# Altium project STEPPER-Board-v1.0.PrjPcb (part 1 of 6)
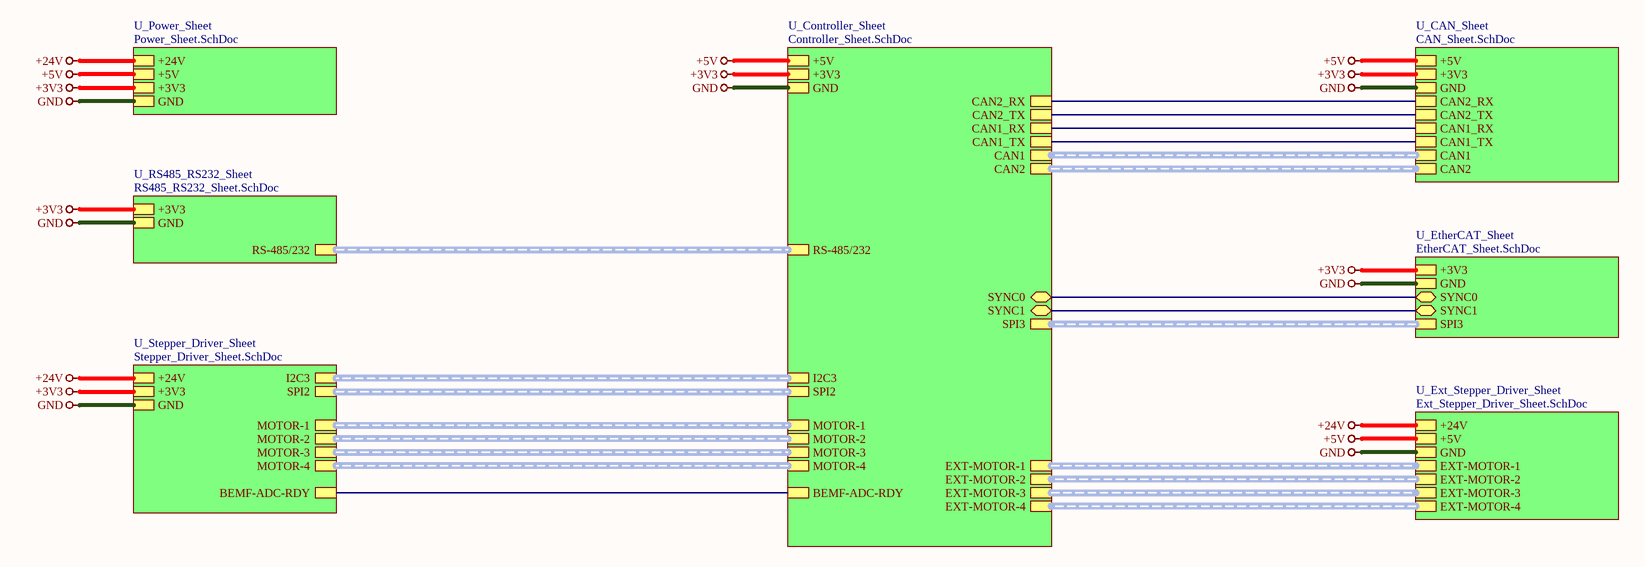
[diagram p0: Top-Sheet.SchDoc]
8 sheets, 410 parts. Net scope: hierarchical (ports join the sheet entries above them; power ports are global).
Board file: Stepper Board-v1.0.PcbDoc
Sheets:
  Top-Sheet.SchDoc
    U_Power_Sheet = Power_Sheet.SchDoc
    U_Controller_Sheet = Controller_Sheet.SchDoc
    U_CAN_Sheet = CAN_Sheet.SchDoc
    U_RS485_RS232_Sheet = RS485_RS232_Sheet.SchDoc
    U_EtherCAT_Sheet = EtherCAT_Sheet.SchDoc
    U_Stepper_Driver_Sheet = Stepper_Driver_Sheet.SchDoc
    U_Ext_Stepper_Driver_Sheet = Ext_Stepper_Driver_Sheet.SchDoc

## Sheet Top-Sheet.SchDoc
size 420 x 297 mm; DocumentNumber: 1; SheetNumber: 1

### Sub-sheets
U_CAN_Sheet = CAN_Sheet.SchDoc: CAN1 (harness CAN1), CAN2_RX, CAN2_TX, +5V, +3V3, GND, CAN1_RX, CAN1_TX, CAN2 (harness CAN2)
U_Controller_Sheet = Controller_Sheet.SchDoc: RS-485/232 (harness RS-485/232), CAN1 (harness CAN1), +3V3, GND, CAN2 (harness CAN2), SPI3 (harness SPI3), SPI2 (harness SPI2), I2C3 (harness I2C3), MOTOR-1 (harness MOTOR-1), MOTOR-2 (harness MOTOR-2), MOTOR-3 (harness MOTOR-3), MOTOR-4 (harness MOTOR-4), +5V, SYNC0 (bidir), SYNC1 (bidir), BEMF-ADC-RDY, EXT-MOTOR-1 (harness EXT-MOTOR-1), EXT-MOTOR-2 (harness EXT-MOTOR-2), EXT-MOTOR-3 (harness EXT-MOTOR-3), EXT-MOTOR-4 (harness EXT-MOTOR-4), CAN2_RX, CAN2_TX, CAN1_RX, CAN1_TX
U_EtherCAT_Sheet = EtherCAT_Sheet.SchDoc: +3V3, GND, SYNC0 (bidir), SYNC1 (bidir), SPI3 (harness SPI3)
U_Ext_Stepper_Driver_Sheet = Ext_Stepper_Driver_Sheet.SchDoc: +5V, GND, EXT-MOTOR-1 (harness EXT-MOTOR-1), EXT-MOTOR-2 (harness EXT-MOTOR-2), EXT-MOTOR-3 (harness EXT-MOTOR-3), EXT-MOTOR-4 (harness EXT-MOTOR-4), +24V
U_Power_Sheet = Power_Sheet.SchDoc: +24V, +5V, +3V3, GND
U_RS485_RS232_Sheet = RS485_RS232_Sheet.SchDoc: RS-485/232 (harness RS-485/232), +3V3, GND
U_Stepper_Driver_Sheet = Stepper_Driver_Sheet.SchDoc: +24V, +3V3, GND, I2C3 (harness I2C3), SPI2 (harness SPI2), MOTOR-1 (harness MOTOR-1), MOTOR-2 (harness MOTOR-2), MOTOR-3 (harness MOTOR-3), MOTOR-4 (harness MOTOR-4), BEMF-ADC-RDY

### Nets
+3V3: sheet U_Power_Sheet/+3V3, sheet U_Controller_Sheet/+3V3, sheet U_CAN_Sheet/+3V3, sheet U_RS485_RS232_Sheet/+3V3, sheet U_EtherCAT_Sheet/+3V3, sheet U_Stepper_Driver_Sheet/+3V3
+5V: sheet U_Power_Sheet/+5V, sheet U_Controller_Sheet/+5V, sheet U_CAN_Sheet/+5V, sheet U_Ext_Stepper_Driver_Sheet/+5V
+24V: sheet U_Power_Sheet/+24V, sheet U_Stepper_Driver_Sheet/+24V, sheet U_Ext_Stepper_Driver_Sheet/+24V
GND: sheet U_Power_Sheet/GND, sheet U_Controller_Sheet/GND, sheet U_CAN_Sheet/GND, sheet U_RS485_RS232_Sheet/GND, sheet U_EtherCAT_Sheet/GND, sheet U_Stepper_Driver_Sheet/GND, sheet U_Ext_Stepper_Driver_Sheet/GND
BEMF-ADC-RDY: sheet U_Controller_Sheet/BEMF-ADC-RDY, sheet U_Stepper_Driver_Sheet/BEMF-ADC-RDY
CAN1_RX: sheet U_Controller_Sheet/CAN1_RX, sheet U_CAN_Sheet/CAN1_RX
CAN1_TX: sheet U_Controller_Sheet/CAN1_TX, sheet U_CAN_Sheet/CAN1_TX
CAN2_RX: sheet U_Controller_Sheet/CAN2_RX, sheet U_CAN_Sheet/CAN2_RX
CAN2_TX: sheet U_Controller_Sheet/CAN2_TX, sheet U_CAN_Sheet/CAN2_TX
SYNC0: sheet U_Controller_Sheet/SYNC0, sheet U_EtherCAT_Sheet/SYNC0
SYNC1: sheet U_Controller_Sheet/SYNC1, sheet U_EtherCAT_Sheet/SYNC1

### Buses and harness runs
harness sheet U_CAN_Sheet/CAN1 = sheet U_Controller_Sheet/CAN1
harness sheet U_CAN_Sheet/CAN2 = sheet U_Controller_Sheet/CAN2
harness sheet U_Controller_Sheet/EXT-MOTOR-1 = sheet U_Ext_Stepper_Driver_Sheet/EXT-MOTOR-1
harness sheet U_Controller_Sheet/EXT-MOTOR-2 = sheet U_Ext_Stepper_Driver_Sheet/EXT-MOTOR-2
harness sheet U_Controller_Sheet/EXT-MOTOR-3 = sheet U_Ext_Stepper_Driver_Sheet/EXT-MOTOR-3
harness sheet U_Controller_Sheet/EXT-MOTOR-4 = sheet U_Ext_Stepper_Driver_Sheet/EXT-MOTOR-4
harness sheet U_Controller_Sheet/I2C3 = sheet U_Stepper_Driver_Sheet/I2C3
harness sheet U_Controller_Sheet/MOTOR-1 = sheet U_Stepper_Driver_Sheet/MOTOR-1
harness sheet U_Controller_Sheet/MOTOR-2 = sheet U_Stepper_Driver_Sheet/MOTOR-2
harness sheet U_Controller_Sheet/MOTOR-3 = sheet U_Stepper_Driver_Sheet/MOTOR-3
harness sheet U_Controller_Sheet/MOTOR-4 = sheet U_Stepper_Driver_Sheet/MOTOR-4
harness sheet U_Controller_Sheet/RS-485/232 = sheet U_RS485_RS232_Sheet/RS-485/232
harness sheet U_Controller_Sheet/SPI2 = sheet U_Stepper_Driver_Sheet/SPI2
harness sheet U_Controller_Sheet/SPI3 = sheet U_EtherCAT_Sheet/SPI3

### Notes on the sheet
- File:
- Title:
- Date:
- Page
- Num:
- Total:
- Drawn By: Huzaifa Ali

## Sheet Power_Sheet.SchDoc
size 420 x 297 mm; DocumentNumber: 2; SheetNumber: 2; SheetTotal: 14
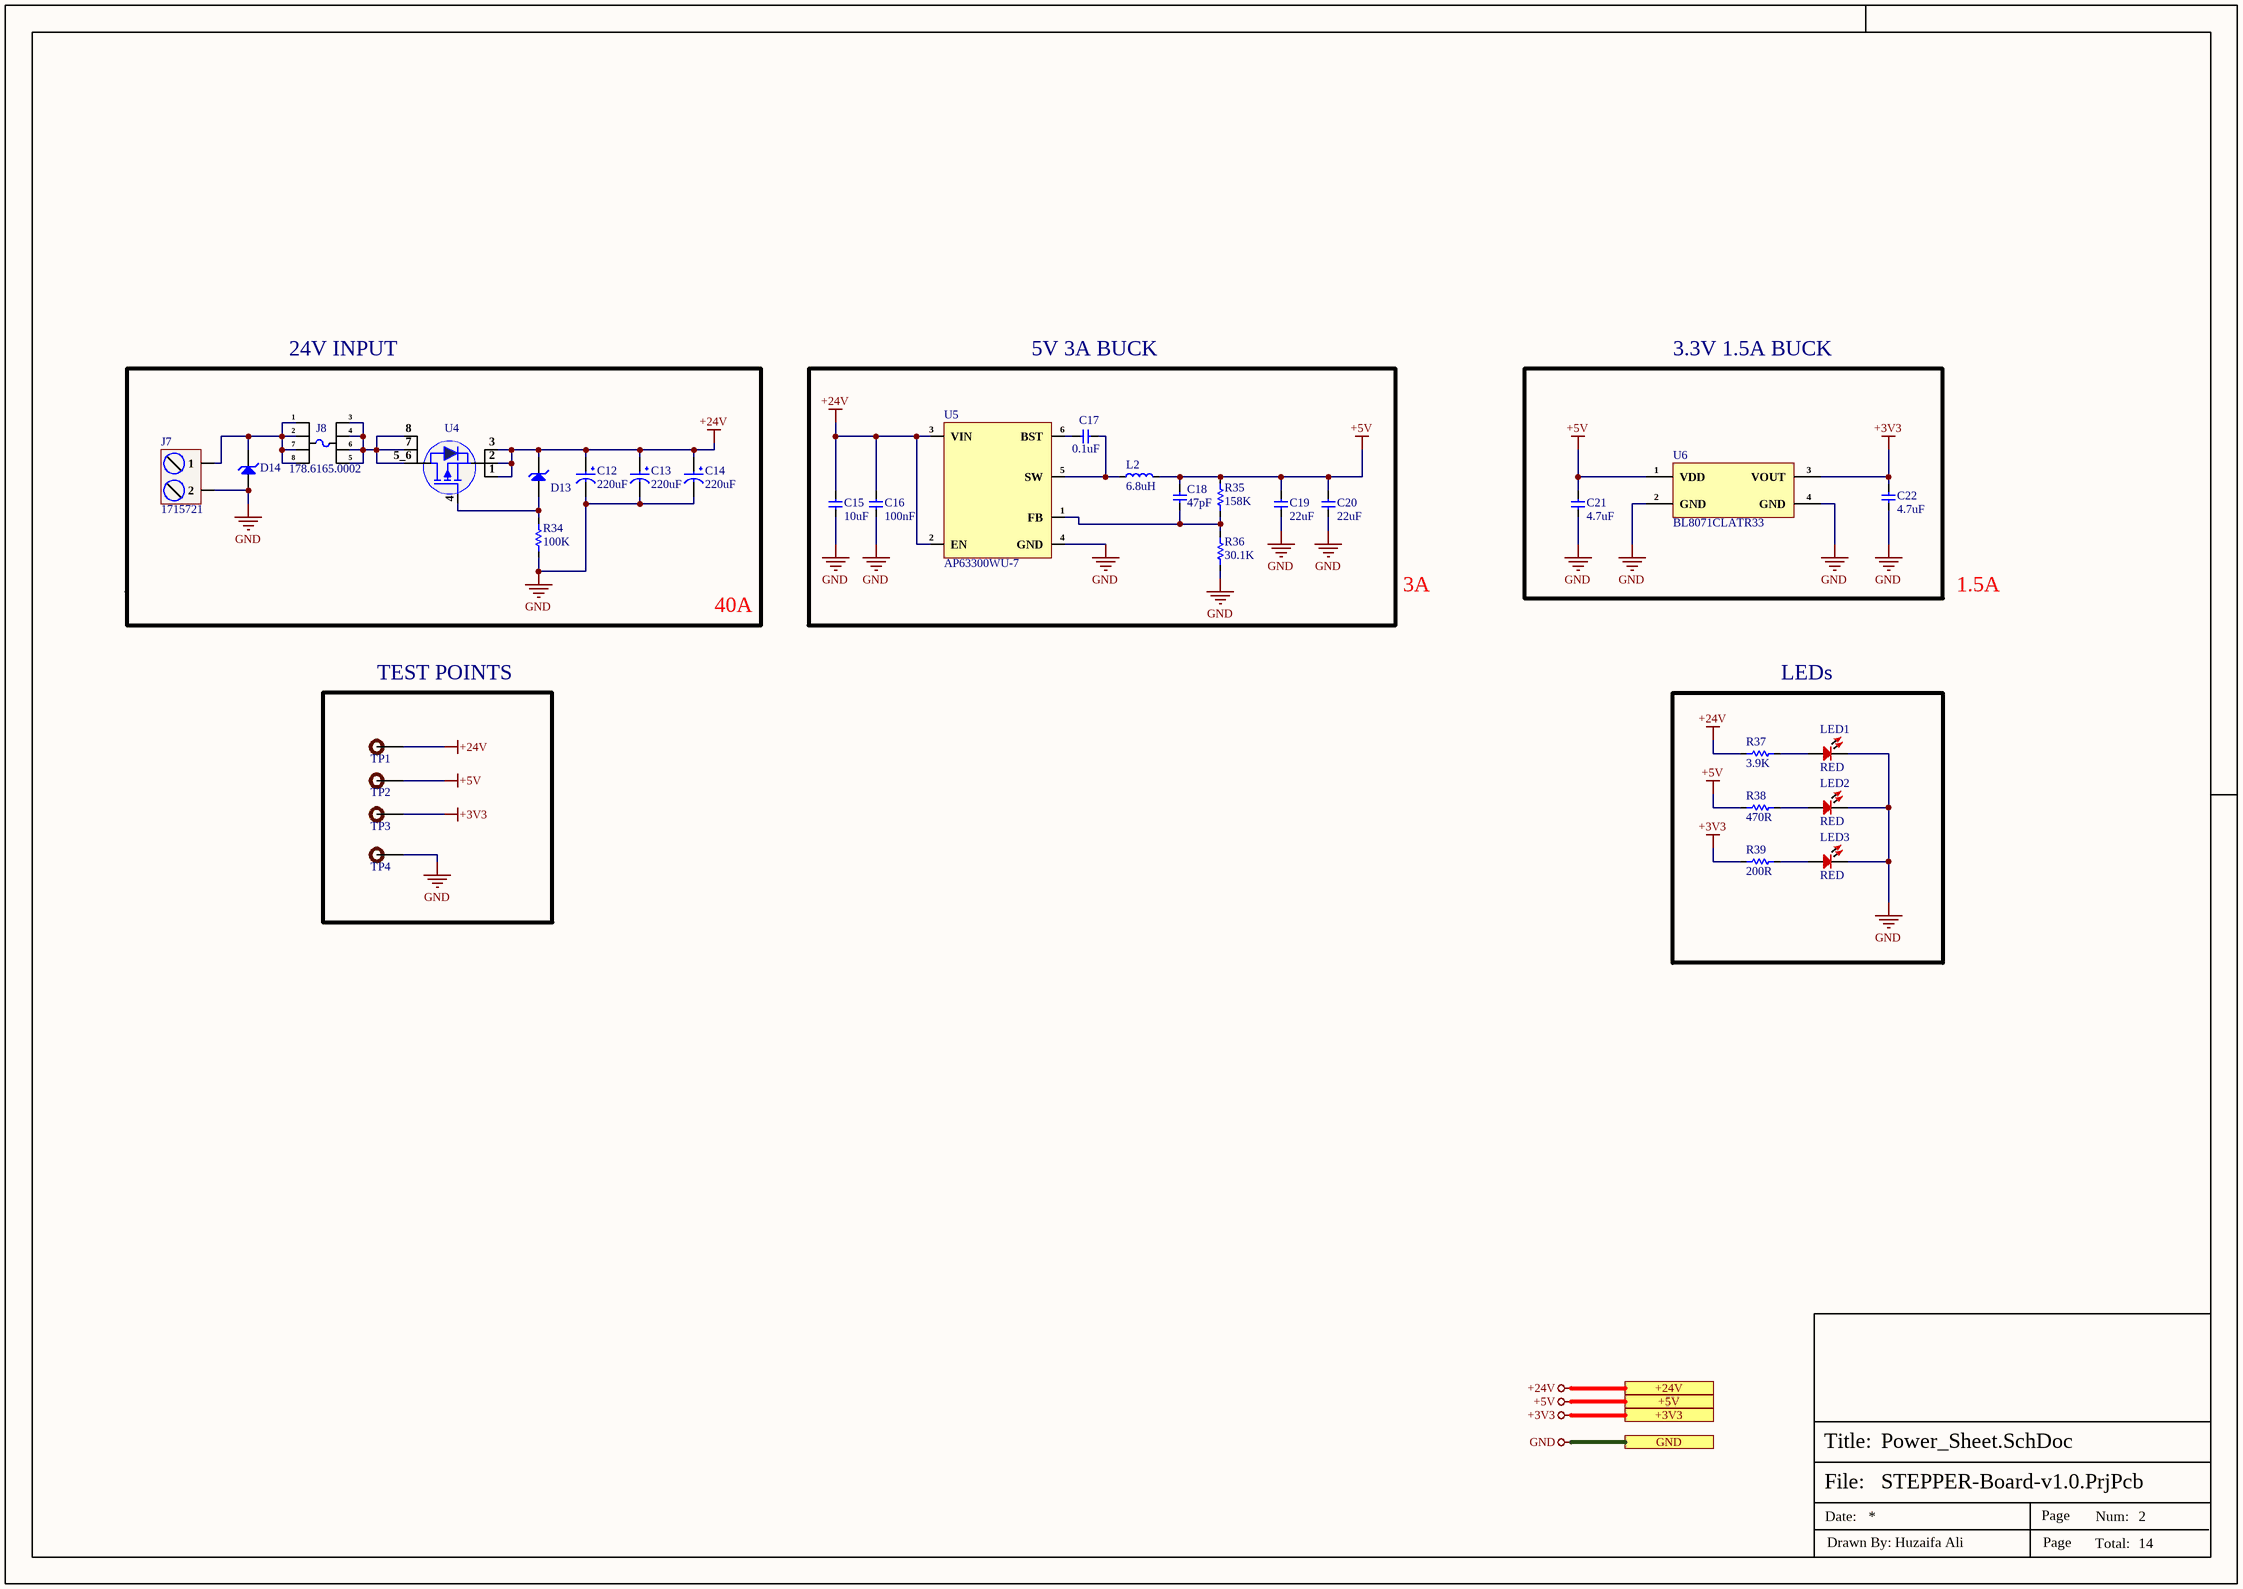
[diagram p1: Power_Sheet.SchDoc]

### Parts
C12  220uF  [UCD-220uF-10mmDia]
C13  220uF  [UCD-220uF-10mmDia]
C14  220uF  [UCD-220uF-10mmDia]
C15  10uF  [Cap-1206]
C16  100nF  [cap-0402]
C17  0.1uF  [Cap-0402]
C18  47pF  [Cap-0402]
C19  22uF  [Cap-0805]
C20  22uF  [Cap-0805]
C21  4.7uF  [Cap-0603]
C22  4.7uF  [Cap-0603]
D13  BZT52C16  [SOD-123]  (value not drawn)
D14  SMBJ28A-13-F  [SMB_]  (value not drawn)
J7  1715721  [1715721]
J8  178.6165.0002  [178.6165.0002]
L2  6.8uH  [0630CDMCCDS_6R8MC]
LED1  RED  [LED-0603]
LED2  RED  [LED-0603]
LED3  RED  [LED-0603]
R34  100K  [Res-0402]
R35  158K  [Res-0402]
R36  30.1K  [Res-0402]
R37  3.9K  [Res-0402]
R38  470R  [Res-0402]
R39  200R  [Res-0402]
TP1  TEST POINT  [Test-point]  (value not drawn)  (no BOM)
TP2  TEST POINT  [Test-point]  (value not drawn)  (no BOM)
TP3  TEST POINT  [Test-point]  (value not drawn)  (no BOM)
TP4  TEST POINT  [Test-point]  (value not drawn)  (no BOM)
U4  SI7145DP-T1-GE3  [PowerPAK-SO-8]  (value not drawn)
U5  AP63300WU-7  [TSOT-23-6]
U6  BL8071CLATR33  [SOT- 223]

### Blocks framed on the sheet
5V 3A BUCK: C15-C20 L2 R35 R36 U5
3.3V 1.5A BUCK: C21 C22 U6
TEST POINTS: TP1-TP4

### Ports
+3V3 (see Top-Sheet[1A], CAN_Sheet[5D], Controller_Sheet[5D], EtherCAT_Sheet[5D], RS485_RS232_Sheet[2D], Stepper_Driver_Sheet[5D]), +5V (see Top-Sheet[1A], CAN_Sheet[5D], Controller_Sheet[5D], Ext_Stepper_Driver_Sheet[5D]), +24V (see Top-Sheet[1A], Ext_Stepper_Driver_Sheet[5D], Stepper_Driver_Sheet[5D]), GND (see Top-Sheet[1A], CAN_Sheet[5D], Controller_Sheet[5D], EtherCAT_Sheet[5D], Ext_Stepper_Driver_Sheet[5D], RS485_RS232_Sheet[2D], Stepper_Driver_Sheet[5D])

### Nets
+3V3: C22.2 R39.1 TP3.1 U6.3(VOUT) ; port +3V3
+5V: C18.2 C19.2 C20.2 C21.2 L2.2 R35.2 R38.1 TP2.1 U6.1(VDD) ; port +5V
+24V: C12.1 C13.1 C14.1 C15.2 C16.2 D13.2(K) R37.1 TP1.1 U4.1(S) U4.2(S) U4.3(S) U5.2(EN) U5.3(VIN) ; port +24V
GND: C12.2 C13.2 C14.2 C15.1 C16.1 C19.1 C20.1 C21.1 C22.1 D14.1(A) J7.2 LED1.2 LED2.2 LED3.2 R34.1 R36.1 TP4.1 U5.4(GND) U6.2(GND) U6.4(GND) ; port GND
NetC17_1: C17.1 L2.1 U5.5(SW)
NetC17_2: C17.2 U5.6(BST)
NetC18_1: C18.1 R35.1 R36.2 U5.1(FB)
NetD13_1: D13.1(A) R34.2 U4.4(G)
NetD14_2: D14.2(K) J7.1 J8.1 J8.2 J8.7 J8.8
NetJ8_3: J8.3 J8.4 J8.5 J8.6 U4.5_6(D) U4.7(D) U4.8(D)
NetLED1_1: LED1.1 R37.2
NetLED2_1: LED2.1 R38.2
NetLED3_1: LED3.1 R39.2

### Notes on the sheet
- 24V INPUT
- 3A
- 1.5A
- 40A
- LEDs
- File:
- Title:
- Date:
- Page
- Num:
- Total:
- Drawn By: Huzaifa Ali

### Library data of the parts
C12-C14 = UCD1H221MNL1GS: CAP ALUM 220UF 20% 50V SMD; Manufacturer: Nichicon; Ripple Current: 700mA; Impedance: 160mR; Leakage Current: 3uA; Life (Hours): 5000Hour; Dissipation Factor: 0.1%; Item Type: Capacitor; Supplier 1: Digi-Key; Manufacturer Part Number: UCD1H221MNL1GS; RoHS: Yes; Category: Aluminum Electrolytic Capacitors; Pricing 1: 1=0.85000, 10=0.60200, 50=0.45480, 100=0.39620 (USD); Mount: Surface Mount,PCB; Case/Package: Radial; Min Operating Temperature: -55°C; Max Operating Temperature: 105°C; Capacitance: 220uF; Tolerance: 20%; Voltage Rating: 50V; Packaging: Tape and Reel; Package Quantity: 1; Voltage Rating (DC): 50V; Termination: SMD/SMT; Voltage: 50V; Features: General Purpose; Series: CD; Construction: Cylindrical; Diameter: 10mm; Length: 10mm; Height: 10mm; Height - Seated (Max): 0.394inch; Radiation Hardening: No; Lead Free: Lead Free; RoHS Compliant: Yes; ComponentLink1URL: https://datasheet.ciiva.com/11776/0900766b80ebdadd-11776792.pdf?src-supplier=RSComponents; ComponentLink1Description: https://datasheet.ciiva.com/11776/0900766b80ebdadd-11776792.pdf?src-supplier=RSComponents; ComponentLink2URL: https://datasheet.ciiva.com/5362/e-cd-22158-5362489.pdf?src-supplier=Mouser; ComponentLink2Description: https://datasheet.ciiva.com/5362/e-cd-22158-5362489.pdf?src-supplier=Mouser; ComponentLink3URL: https://datasheet.ciiva.com/11684/e-cd-11684678.pdf?src-supplier=Avnet; ComponentLink3Description: https://datasheet.ciiva.com/11684/e-cd-11684678.pdf?src-supplier=Avnet; ComponentLink4URL: https://datasheet.ciiva.com/15037/e-cd-15037119.pdf?src-supplier=Digi-Key; ComponentLink4Description: https://datasheet.ciiva.com/15037/e-cd-15037119.pdf?src-supplier=Digi-Key; ComponentLink5URL: https://datasheet.ciiva.com/16393/e-cd-16393493.pdf?src-supplier=Future+Electronics; ComponentLink5Description: https://datasheet.ciiva.com/16393/e-cd-16393493.pdf?src-supplier=Future+Electronics; ComponentLink6URL: https://datasheet.ciiva.com/17354/e-cd-17354606.pdf?src-supplier=Avnet+Europe; ComponentLink6Description: https://datasheet.ciiva.com/17354/e-cd-17354606.pdf?src-supplier=Avnet+Europe; Supplier Part Number 1: 493-6390-1-ND; LCSC Part Number: C116211
C15 = CC1206KKX5R9BB106: CAP CER 10UF 50V X5R 1206; Manufacturer: Yageo; Item Type: Capacitors; Material: 4241ConductorMaterial; Tolerance: 10%; Supplier: Future Electronics; Supplier Part Number: 2072123; Manufacturer Part Number: CC1206KKX5R9BB106; RoHS: Yes; Stock: 220000; Pricing: 2000=0.0907, 6000=0.0872, 10000=0.0856, 30000=0.0823, 50000=0.0795 (USD); Mounting Technology: Surface Mount; Case/Package: 1206; Case Code (Imperial): 1206; Case Code (Metric): 3216; Min Operating Temperature: -55°C; Max Operating Temperature: 85°C; Packaging: Cut Tape; Value: 10uF; Voltage Rating: 50V; Voltage Rating (DC): 50V; Dielectric: X5R; Series: CC; Length: 0.126inch; Width: 0.063inch; Height: 1.9mm; Thickness: 0.075inch; Lead Free: Lead Free; Halogen Free: Halogen Free; RoHS Compliant: Yes; ComponentLink1URL: https://datasheet.octopart.com/CC1206KKX5R9BB106-Yageo-datasheet-170350636.pdf?src-supplier=Future+Electronics; ComponentLink1Description: https://datasheet.octopart.com/CC1206KKX5R9BB106-Yageo-datasheet-170350636.pdf?src-supplier=Future+Electronics; ComponentLink2URL: https://datasheet.octopart.com/CC1206KKX5R9BB106-Yageo-datasheet-145016144.pdf?src-supplier=Future+Electronics; ComponentLink2Description: https://datasheet.octopart.com/CC1206KKX5R9BB106-Yageo-datasheet-145016144.pdf?src-supplier=Future+Electronics; ComponentLink3URL: http://www.yageo.com/documents/recent/UPY-GPHC_X5R_4V-to-50V_25.pdf?src-supplier=Digikey; ComponentLink3Description: http://www.yageo.com/documents/recent/UPY-GPHC_X5R_4V-to-50V_25.pdf?src-supplier=Digikey; LCSC Part Number: C100122
C16 = C1005X7R1H104KT000F: CAP CER 0.1UF 50V X7R 0402; Manufacturer: TDK; Tolerance: 10%; Voltage: 25V; Item Type: Capacitor; Supplier 1: Avnet; Manufacturer Part Number: C1005X7R1H104KT000F; RoHS: No; Category: Ceramic Capacitors; Dielectric: X7R; Supplier Part Number 1: C1005X7R1H104KT000F; LCSC Part Number: C361198; ComponentLink1Description: LCSC; ComponentLink1URL: https://www.lcsc.com/product-detail/Multilayer-Ceramic-Capacitors-MLCC-SMD-SMT_TDK-C1005X7R1H104KT000F_C361198.html
C17 = C1005X5R1H104K050BB: CAP CER 0.1UF 50V X5R 0402; Manufacturer: TDK; Dielectric Material: Ceramic; Capacitance: 100nF; Tolerance: 10%; Item Type: Capacitor; Supplier 1: Digi-Key; Manufacturer Part Number: C1005X5R1H104K050BB; Stock 1: 1455182; Pricing 1: 1=0.12, 10=0.09, 50=0.049, 100=0.04, 500=0.02858, 1000=0.02245, 2500=0.02041, 5000=0.01878 (USD); Mount: Surface Mount; Case/Package: 0402; Case Code (Metric): 1005; Case Code (Imperial): 0402; Weight: 2.3E-05oz; Min Operating Temperature: -55°C; Max Operating Temperature: 85°C; Dielectric: X5R; Voltage Rating: 50V; Packaging: Tape and Reel; Voltage Rating (DC): 50V; Termination: SMD/SMT; Construction: Flat; Package Quantity: 1; Resistor Type: Ceramic; Voltage: 50V; Series: C; Length: 1mm; Width: 0.02inch; Height: 0.5mm; Depth: 0.5mm; Thickness: 0.022inch; Radiation Hardening: No; Lead Free: Lead Free; REACH SVHC: No SVHC; RoHS Compliant: Yes; ComponentLink1URL: https://product.tdk.com/info/en/catalog/spec/mlccspec_commercial_general_midvoltage_en.pdf?src-supplier=Digi-Key; ComponentLink1Description: https://product.tdk.com/info/en/catalog/spec/mlccspec_commercial_general_midvoltage_en.pdf?src-supplier=Digi-Key; ComponentLink2URL: http://www.tdk.co.jp/tefe02/e413_c.pdf?src-supplier=Future+Electronics; ComponentLink2Description: http://www.tdk.co.jp/tefe02/e413_c.pdf?src-supplier=Future+Electronics; ComponentLink3URL: https://www.verical.com/server-webapp/html/getDatasheet?partID=743571&src-supplier=Verical; ComponentLink3Description: https://www.verical.com/server-webapp/html/getDatasheet?partID=743571&src-supplier=Verical; ComponentLink4URL: http://www.tdk.co.jp/tefe02/e412_c.pdf?src-supplier=Avnet+Europe; ComponentLink4Description: http://www.tdk.co.jp/tefe02/e412_c.pdf?src-supplier=Avnet+Europe; Supplier Part Number 1: 445-5942-1-ND; LCSC Part Number: C2181865
C18 = GCM1555C1H470FA16D: CAP CER 47PF 50V C0G/NP0 0402; Manufacturer: Murata; Tolerance: 1%; Supplier 1: Digi-Key; Manufacturer Part Number: GCM1555C1H470FA16D; RoHS: No; Category: Ceramic Capacitors; Stock 1: 27098; Pricing 1: 1=0.11000, 10=0.07900, 50=0.04500, 100=0.03730, 500=0.02618, 1000=0.02168, 2500=0.02018, 5000=0.01846 (USD); Mount: Surface Mount; Case/Package: 0402; Case Code (Imperial): 0402; Case Code (Metric): 1005; Min Operating Temperature: -55°C; Max Operating Temperature: 125°C; Packaging: Tape and Reel; Capacitance: 47pF; Voltage Rating: 50V; Ratings: AEC-Q200; ComponentLink1URL: http://search.murata.co.jp/Ceramy/image/img/A01X/G101/ENG/GCM1555C1H470FA16-01.pdf?src-supplier=Digi-Key; ComponentLink1Description: http://search.murata.co.jp/Ceramy/image/img/A01X/G101/ENG/GCM1555C1H470FA16-01.pdf?src-supplier=Digi-Key; Supplier Part Number 1: 490-16445-1-ND; LCSC Part Number: C393684
C19 C20 = CC0805MKX5R8BB226: CAP CER 22UF 25V X5R 0805; Manufacturer: Yageo; Tolerance: 20%; Item Type: Capacitor; Supplier 1: Digi-Key; Manufacturer Part Number: CC0805MKX5R8BB226; RoHS: Yes; Category: Ceramic Capacitors; Stock 1: 64970; Pricing 1: 1=0.47000, 10=0.33300, 50=0.25140, 100=0.21900, 500=0.16222, 1000=0.13789 (USD); Mount: Surface Mount; Case/Package: 0805; Case Code (Metric): 2012; Case Code (Imperial): 0805; Weight: 0.000194oz; Min Operating Temperature: -55°C; Max Operating Temperature: 85°C; Packaging: Tape and Reel; Capacitance: 22uF; Voltage Rating: 25V; Dielectric: X5R; Termination: SMD/SMT; Voltage Rating (DC): 25V; Package Quantity: 3000; Length: 0.079inch; Width: 0.049inch; Height: 1.25mm; Thickness: 0.057inch; Lead Free: Lead Free; Halogen Free: Halogen Free; RoHS Compliant: Yes; ComponentLink1URL: http://www.mouser.com/ds/2/447/Yageo_UPY-GP_NP0_16V-to-50V_9-358835.pdf?src-supplier=Mouser; ComponentLink1Description: http://www.mouser.com/ds/2/447/Yageo_UPY-GP_NP0_16V-to-50V_9-358835.pdf?src-supplier=Mouser; ComponentLink2URL: http://www.yageo.com/documents/recent/UPY-GPHC_X5R_4V-to-50V_25.pdf?src-supplier=Digi-Key; ComponentLink2Description: http://www.yageo.com/documents/recent/UPY-GPHC_X5R_4V-to-50V_25.pdf?src-supplier=Digi-Key; Supplier Part Number 1: 311-1903-1-ND; LCSC Part Number: C784585
C21 C22 = CC0603KRX5R7BB475: CAP CER 4.7UF 16V X5R 0603; Manufacturer: Yageo; Tolerance: 10%; Item Type: Capacitor; Supplier 1: Digi-Key; Manufacturer Part Number: CC0603KRX5R7BB475; RoHS: Yes; Category: Ceramic Capacitors; Stock 1: 547703; Pricing 1: 1=0.20000, 10=0.13800, 50=0.08280, 100=0.06990, 500=0.04784, 1000=0.04233 (USD); Mount: Surface Mount; Case/Package: 0603; Case Code (Imperial): 0603; Case Code (Metric): 1608; Weight: 7.1E-05oz; Min Operating Temperature: -55°C; Max Operating Temperature: 85°C; Capacitance: 4.7uF; Voltage Rating: 16V; Voltage Rating (DC): 16V; Packaging: Tape and Reel; Dielectric: X5R; Termination: SMD/SMT; Resistor Type: Ceramic; Series: CC; Length: 1.6mm; Width: 0.8mm; Height: 0.8mm; Thickness: 0.037inch; Depth: 0.8mm; Lead Free: Lead Free; Halogen Free: Halogen Free; RoHS Compliant: Yes; ComponentLink1URL: http://www.mouser.com/ds/2/447/UPY-GPHC_X5R_4V-to-50V_25-1131599.pdf?src-supplier=Mouser; ComponentLink1Description: http://www.mouser.com/ds/2/447/UPY-GPHC_X5R_4V-to-50V_25-1131599.pdf?src-supplier=Mouser; ComponentLink2URL: http://www.yageo.com/documents/recent/UPY-GPHC_X5R_4V-to-50V_25.pdf?src-supplier=Digi-Key; ComponentLink2Description: http://www.yageo.com/documents/recent/UPY-GPHC_X5R_4V-to-50V_25.pdf?src-supplier=Digi-Key; Supplier Part Number 1: 311-1785-1-ND; LCSC Part Number: C277476
D13 = BZT52C16: ±5% Single 15.3V~17.1V 500mW 16V SOD-123 Zener Diodes ROHS; Manufacturer: Shikues; Manufacturer Part Number: BZT52C16; Package: SOD-123; LCSC Part Number: C216724; Item Type: Zener Diode; ComponentLink1Description: LCSC; ComponentLink1URL: https://www.lcsc.com/product-detail/Zener-Diodes_Shikues-BZT52C16_C216724.html
D14 = SMBJ28A-13-F: TVS DIODE 28VWM 45.4VC SMB; Manufacturer: Diodes; Test Current: 1mA; Number of Elements: 1; Power Dissipation: 600W; Forward Voltage: 5V; Direction: Unidirectional; Reverse Breakdown Voltage: 31.1V; Max Surge Current: 13.2A; Reverse Standoff Voltage: 28V; Clamping Voltage: 45.4V; Power Line Protection: No; Breakdown Voltage: 35.8V; Max Reverse Leakage Current: 5uA; Value: 330pF; Diode Type: ZENER; Supplier: Future Electronics; Supplier Part Number: 8797342; Manufacturer Part Number: SMBJ28A-13-F; RoHS: Yes; Category: TVS Diodes; Stock: 39000; Pricing: 3000=0.0734, 9000=0.0706, 15000=0.0693, 30000=0.0676, 60000=0.065 (USD); Mounting Technology: Surface Mount; Case/Package: SMB; Pins: 2; Min Operating Temperature: -55°C; Max Operating Temperature: 150°C; Packaging: Tape and Reel; Package Quantity: 3000; Max Power Dissipation: 600W; Series: SMBJ; Number of Unidirectional Channels: 1; Min Breakdown Voltage: 31.1V; Peak Pulse Power: 600W; Polarity: Unidirectional; Termination: SMD/SMT; Peak Pulse Current: 13.2A; Max Breakdown Voltage: 35.8V; Leakage Current: 5uA; Working Voltage: 28V; Voltage Rating (DC): 28V; Max Output current: 13.2A; Clamping Voltage-Max: 45.4V; Length: 4.57mm; Width: 3.9mm; Height: 2.62mm; Radiation Hardening: No; RoHS Compliant: Yes; Lead Free: Lead Free; ComponentLink1URL: https://datasheet.ciiva.com/16387/ds19002-16387564.pdf?src-supplier=Future+Electronics; ComponentLink1Description: https://datasheet.ciiva.com/16387/ds19002-16387564.pdf?src-supplier=Future+Electronics; ComponentLink2URL: https://datasheet.ciiva.com/26912/getdatasheetpartid-234000-26912533.pdf?src-supplier=Verical; ComponentLink2Description: https://datasheet.ciiva.com/26912/getdatasheetpartid-234000-26912533.pdf?src-supplier=Verical; Item Type: Diode
J7 = 1715721: TERM BLK 2P SIDE ENT 5.08MM PCB; Manufacturer: Phoenix Contact; Item Type: Terminal Blocks; Supplier: Digikey; Supplier Part Number: 277-1263-ND; Manufacturer Part Number: 1715721; RoHS: Yes; Stock: 13160; Pricing: 1=0.94 (USD); ComponentLink1URL: https://datasheet.ciiva.com/1120/1697161-1120393.pdf?src-supplier=Farnell; ComponentLink1Description: https://datasheet.ciiva.com/1120/1697161-1120393.pdf?src-supplier=Farnell; ComponentLink2URL: https://datasheet.ciiva.com/832/1715721-832095.pdf?src-supplier=Digikey; ComponentLink2Description: https://datasheet.ciiva.com/832/1715721-832095.pdf?src-supplier=Digikey; ComponentLink3URL: https://datasheet.ciiva.com/15169/getdatasheetpartid-212174-15169929.pdf?src-supplier=Verical; ComponentLink3Description: https://datasheet.ciiva.com/15169/getdatasheetpartid-212174-15169929.pdf?src-supplier=Verical; ComponentLink4URL: https://datasheet.ciiva.com/16046/1715721-16046034.pdf?src-supplier=Onlinecomponents.com; ComponentLink4Description: https://datasheet.ciiva.com/16046/1715721-16046034.pdf?src-supplier=Onlinecomponents.com
J8 = 178.6165.0002: FUSE HOLDER BLADE 80V PCB; Manufacturer: Littelfuse Wickmann; Body Material: 4896ConductorMaterial; Current Rating: 30A; Supplier: Future Electronics; Supplier Part Number: 9883406; Manufacturer Part Number: 178.6165.0002; RoHS: Yes; Category: Fuse Holders; Stock: 3811; Pricing: 1=2.02, 40=1.96, 125=1.91, 400=1.86, 1250=1.77 (USD); Material: 4896ConductorMaterial; Width: 17.5mm; Thickness: 6mm; Lead Free: 5697LeadFree; ComponentLink1URL: https://datasheet.ciiva.com/295/littelfuse-ato-pcb-fuse-holders-178-6765-295568.pdf?src-supplier=Digikey; ComponentLink1Description: https://datasheet.ciiva.com/295/littelfuse-ato-pcb-fuse-holders-178-6765-295568.pdf?src-supplier=Digikey; ComponentLink2URL: https://datasheet.ciiva.com/4480/flrholder-58019-4480354.pdf?src-supplier=Mouser; ComponentLink2Description: https://datasheet.ciiva.com/4480/flrholder-58019-4480354.pdf?src-supplier=Mouser; ComponentLink3URL: https://datasheet.ciiva.com/16372/flrholder-16372408.pdf?src-supplier=Future+Electronics; ComponentLink3Description: https://datasheet.ciiva.com/16372/flrholder-16372408.pdf?src-supplier=Future+Electronics; ComponentLink4URL: https://datasheet.ciiva.com/15187/getdatasheetpartid-31610-15187861.pdf?src-supplier=Verical; ComponentLink4Description: https://datasheet.ciiva.com/15187/getdatasheetpartid-31610-15187861.pdf?src-supplier=Verical; LCSC Part Number: C207061; Item Type: Fuse Holder
L2 = 0630CDMCCDS-6R8MC: FIXED IND 6.8UH 5A 48 MOHM SMD; Manufacturer: Sumida; Core Material: Metal; Saturation Current: 6.3A; Shielding: Shielded; DC Resistance (DCR): 48mR; Test Frequency: 100kHz; Tolerance: 20%; Item Type: Inductor; Supplier 1: Digi-Key; Manufacturer Part Number: 0630CDMCCDS-6R8MC; Stock 1: 1582; Pricing 1: 1=0.97, 10=0.845, 25=0.7848, 50=0.6642, 100=0.6038, 250=0.56752, 500=0.50716 (USD); Mount: Surface Mount; Case/Package: Nonstandard; Min Operating Temperature: -55°C; Max Operating Temperature: 125°C; Packaging: Tape and Reel; Inductance: 6.8uH; Current Rating: 5A; Length: 0.276inch; Width: 0.26inch; Height - Seated (Max): 0.118inch; RoHS Compliant: Yes; ComponentLink1URL: http://products.sumida.com/products/pdf/0630CDMCDDS.pdf?src-supplier=Digi-Key; ComponentLink1Description: http://products.sumida.com/products/pdf/0630CDMCDDS.pdf?src-supplier=Digi-Key; Supplier Part Number 1: 308-2467-1-ND; LCSC Part Number: C167295
LED1-LED3 = NCD0603R3: RED LED 0603 Light Emitting Diodes; Manufacturer: Foshan NationStar Optoelectronics; Manufacturer Part Number: NCD0603R3; Package: 0603; Item Type: LED; LCSC Part Number: C3151730; ComponentLink1Description: LCSC; ComponentLink1URL: https://www.lcsc.com/product-detail/Light-Emitting-Diodes-LED_Foshan-NationStar-Optoelectronics-NCD0603R3_C3151730.html
R34 = RC0402FR-07100KL: RES 100K OHM 1% 1/16W 0402; Manufacturer: Yageo; Resistance: 100kR; Temperature Coefficient: 100ppm/°C; Power Rating: 63mW; Voltage Rating: 50V; Item Type: Resistor; Supplier 1: Mouser; Manufacturer Part Number: RC0402FR-07100KL; RoHS: Yes; Category: Chip SMD Resistors; Stock 1: 7759549; Pricing 1: 1=0.10000, 10=0.01200, 50=0.01200, 100=0.00500, 1000=0.00300, 2500=0.00200, 10000=0.00100 (USD); Case/Package: 0402; Case Code (Metric): 1005; Case Code (Imperial): 0402; Min Operating Temperature: -55°C; Max Operating Temperature: 155°C; Resistor Type: Thick Film; Tolerance: 1%; Packaging: Tape and Reel; Package Quantity: 1; Number of Terminations: 2; Termination: SMD/SMT; Max Power Dissipation: 63mW; Working Voltage: 50V; Features: Moisture Resistant; Series: RC; Resistance Tolerance: 1%; Construction: Rectangular; Technology: THICK FILM; Length: 0.039inch; Width: 0.02inch; Height: 0.016inch; Depth: 0.5mm; REACH SVHC: No SVHC; Lead Free: Lead Free; RoHS Compliant: Yes; Military Standard: Not; ComponentLink1URL: https://datasheet.ciiva.com/11819/0900766b80c66297-11819452.pdf?src-supplier=RSComponents; ComponentLink1Description: https://datasheet.ciiva.com/11819/0900766b80c66297-11819452.pdf?src-supplier=RSComponents; ComponentLink2URL: https://datasheet.ciiva.com/22747/1018594-22747509.pdf?src-supplier=Element14; ComponentLink2Description: https://datasheet.ciiva.com/22747/1018594-22747509.pdf?src-supplier=Element14; ComponentLink3URL: https://datasheet.ciiva.com/2453/pyu-r-int-thick-7-2453362.pdf?src-supplier=Digi-Key; ComponentLink3Description: https://datasheet.ciiva.com/2453/pyu-r-int-thick-7-2453362.pdf?src-supplier=Digi-Key; ComponentLink4URL: https://datasheet.ciiva.com/2453/pyu-r-int-thick-7-2453363.pdf?src-supplier=Digi-Key; ComponentLink4Description: https://datasheet.ciiva.com/2453/pyu-r-int-thick-7-2453363.pdf?src-supplier=Digi-Key; ComponentLink5URL: https://datasheet.ciiva.com/2453/pyu-r-int-thick-7-2453361.pdf?src-supplier=Digi-Key; ComponentLink5Description: https://datasheet.ciiva.com/2453/pyu-r-int-thick-7-2453361.pdf?src-supplier=Digi-Key; ComponentLink6URL: https://datasheet.ciiva.com/12667/pyu-rc0402-51-rohs-l-6-r-12667930.pdf?src-supplier=Mouser; ComponentLink6Description: https://datasheet.ciiva.com/12667/pyu-rc0402-51-rohs-l-6-r-12667930.pdf?src-supplier=Mouser; ComponentLink7URL: https://datasheet.ciiva.com/15189/getdatasheetpartid-323696-15189334.pdf?src-supplier=Verical; ComponentLink7Description: https://datasheet.ciiva.com/15189/getdatasheetpartid-323696-15189334.pdf?src-supplier=Verical; Supplier Part Number 1: 603-RC0402FR-07100KL; LCSC Part Number: C60491
R35 = RT0402BRE07158KL: RES 158K OHM 0.1% 1/16W 0402; Manufacturer: Yageo; Item Type: Resistor; Supplier: Digikey; Supplier Part Number: RT0402BRE07158KL-ND; Manufacturer Part Number: RT0402BRE07158KL; RoHS: Yes; Pricing: 10000=0.08507 (USD); LCSC Part Number: C853045
R36 = RT0402BRD0730K1L: RES SMD 30.1KOHM 0.1% 1/16W 0402; Manufacturer: Yageo; Item Type: Resistor; Supplier: Rs; Supplier Part Number: 1991324P; Manufacturer Part Number: RT0402BRD0730K1L; RoHS: Yes; Category: Chip SMD Resistors; Stock: 7420; Pricing: 100=0.138, 250=0.115, 500=0.092, 1000=0.076 (GBP); ComponentLink1URL: https://datasheet.ciiva.com/12722/pyu-rt-1-to-0-05-rohs-l-4-12722119.pdf?src-supplier=Mouser; ComponentLink1Description: https://datasheet.ciiva.com/12722/pyu-rt-1-to-0-05-rohs-l-4-12722119.pdf?src-supplier=Mouser; ComponentLink2URL: https://datasheet.ciiva.com/2582/pyu-rt-1-to-0-05-rohs-l-5-2582303.pdf?src-supplier=Digi-Key; ComponentLink2Description: https://datasheet.ciiva.com/2582/pyu-rt-1-to-0-05-rohs-l-5-2582303.pdf?src-supplier=Digi-Key; LCSC Part Number: C852714
R37 = RC0402FR-073K9L: RES 3.9K OHM 1% 1/16W 0402; Manufacturer: Yageo; Temperature Coefficient: 100ppm/°C; Power Rating: 62.5mW; Value: 3.9kR; Voltage Rating: 50V; Max Power Dissipation: 63mW; Item Type: Resistor; Supplier: Future Electronics; Supplier Part Number: 9808155; Manufacturer Part Number: RC0402FR-073K9L; RoHS: Yes; Category: Chip SMD Resistors; Stock: 6910000; Pricing: 10000=0.0011, 100000=0.0011, 300000=0.001, 750000=0.001, 2000000=0.0009 (USD); Case/Package: 0402; Case Code (Imperial): 0402; Case Code (Metric): 1005; Min Operating Temperature: -55°C; Max Operating Temperature: 155°C; Tolerance: 1%; Packaging: Tape and Reel; Resistor Type: Thick Film; Series: RC; Termination: SMD/SMT; Number of Terminations: 2; Features: Moisture Resistant; Resistance Tolerance: 1%; Construction: Rectangular; Voltage Rating (AC): 50V; Length: 1mm; Depth: 0.5mm; Lead Free: Lead Free; RoHS Compliant: Yes; Reach SVHC Compliant: Unknown; Military Standard: Not; ComponentLink1URL: https://datasheet.ciiva.com/12666/pyu-rc0402-51-rohs-l-6-r-12666997.pdf?src-supplier=Mouser; ComponentLink1Description: https://datasheet.ciiva.com/12666/pyu-rc0402-51-rohs-l-6-r-12666997.pdf?src-supplier=Mouser; ComponentLink2URL: https://datasheet.ciiva.com/7849/1018594-7849989.pdf?src-supplier=Element14; ComponentLink2Description: https://datasheet.ciiva.com/7849/1018594-7849989.pdf?src-supplier=Element14; ComponentLink3URL: https://datasheet.ciiva.com/7849/1018594-7849990.pdf?src-supplier=Element14; ComponentLink3Description: https://datasheet.ciiva.com/7849/1018594-7849990.pdf?src-supplier=Element14; ComponentLink4URL: https://datasheet.ciiva.com/15189/getdatasheetpartid-469246-15189453.pdf?src-supplier=Verical; ComponentLink4Description: https://datasheet.ciiva.com/15189/getdatasheetpartid-469246-15189453.pdf?src-supplier=Verical; LCSC Part Number: C131467
R38 = RC0402FR-07470RL: RES 470 OHM 1% 1/16W 0402; Manufacturer: Yageo; Item Type: Resistor; Voltage Rating: 50V; Power Rating: 62.5mW; Temperature Coefficient: 100ppm/°C; Max Power Dissipation: 63mW; Supplier: Avnet; Supplier Part Number: RC0402FR-07470RL; Manufacturer Part Number: RC0402FR-07470RL; RoHS: Yes; Stock: 10000; Pricing: 10000=0.00085 (USD); Case/Package: 0402; Case Code (Metric): 1005; Case Code (Imperial): 0402; Min Operating Temperature: -55°C; Max Operating Temperature: 155°C; Packaging: Tape and Reel; Value: 470R; Tolerance: 1%; Number of Terminations: 2; Working Voltage: 50V; Package Quantity: 1; Resistor Type: Thick Film; Termination: SMD/SMT; Features: Moisture Resistant; Series: RC; Resistance Tolerance: 1%; Construction: Rectangular; Voltage Rating (AC): 50V; Length: 1mm; Width: 0.02inch; Height: 0.016inch; Depth: 0.5mm; Lead Free: Lead Free; Reach SVHC Compliant: No; RoHS Compliant: Yes; Military Standard: Not; ComponentLink1URL: https://datasheet.ciiva.com/46412/1018594-46412838.pdf?src-supplier=Element14; ComponentLink1Description: https://datasheet.ciiva.com/46412/1018594-46412838.pdf?src-supplier=Element14; ComponentLink2URL: https://datasheet.ciiva.com/2453/pyu-r-int-thick-7-2453377.pdf?src-supplier=Digikey; ComponentLink2Description: https://datasheet.ciiva.com/2453/pyu-r-int-thick-7-2453377.pdf?src-supplier=Digikey; ComponentLink3URL: https://datasheet.ciiva.com/2453/pyu-r-int-thick-7-2453378.pdf?src-supplier=Digikey; ComponentLink3Description: https://datasheet.ciiva.com/2453/pyu-r-int-thick-7-2453378.pdf?src-supplier=Digikey; ComponentLink4URL: https://datasheet.ciiva.com/2453/pyu-r-int-thick-7-2453376.pdf?src-supplier=Digikey; ComponentLink4Description: https://datasheet.ciiva.com/2453/pyu-r-int-thick-7-2453376.pdf?src-supplier=Digikey; ComponentLink5URL: https://datasheet.ciiva.com/7850/1018594-7850015.pdf?src-supplier=Element14; ComponentLink5Description: https://datasheet.ciiva.com/7850/1018594-7850015.pdf?src-supplier=Element14; ComponentLink6URL: https://datasheet.ciiva.com/7850/1018594-7850014.pdf?src-supplier=Element14; ComponentLink6Description: https://datasheet.ciiva.com/7850/1018594-7850014.pdf?src-supplier=Element14; ComponentLink7URL: https://datasheet.ciiva.com/15189/getdatasheetpartid-330246-15189463.pdf?src-supplier=Verical; ComponentLink7Description: https://datasheet.ciiva.com/15189/getdatasheetpartid-330246-15189463.pdf?src-supplier=Verical; LCSC Part Number: C114877
R39 = RC0402FR-07200RL: RES 200 OHM 1% 1/16W 0402; Manufacturer: Yageo; Temperature Coefficient: 100ppm/°C; Power Rating: 63mW; Voltage Rating (DC): 50V; Supplier 1: Digi-Key; Manufacturer Part Number: RC0402FR-07200RL; RoHS: Yes; Category: Chip SMD Resistors; Stock 1: 19778; Pricing 1: 1=0.10000, 10=0.01600, 100=0.00660, 1000=0.00299, 2500=0.00259, 5000=0.00214 (USD); Case/Package: 0402; Case Code (Metric): 1005; Case Code (Imperial): 0402; Size Code: 0402; Min Operating Temperature: -55°C; Max Operating Temperature: 155°C; Tolerance: 1%; Resistance: 200R; Resistor Type: Thick Film; Packaging: Tape and Reel; Voltage Rating: 50V; Package Quantity: 1; Number of Terminations: 2; Termination: SMD/SMT; Max Power Dissipation: 63mW; Features: Moisture Resistant; Series: RC; Construction: Rectangular; Resistance Tolerance: 1%; Length: 1mm; Width: 0.02inch; Height: 0.016inch; Depth: 0.5mm; REACH SVHC: No SVHC; Lead Free: Lead Free; RoHS Compliant: Yes; Military Standard: Not; ComponentLink1URL: https://datasheet.ciiva.com/2553/pyu-r-int-thick-7-2553232.pdf?src-supplier=Digi-Key; ComponentLink1Description: https://datasheet.ciiva.com/2553/pyu-r-int-thick-7-2553232.pdf?src-supplier=Digi-Key; ComponentLink2URL: https://datasheet.ciiva.com/7983/1018594-7983509.pdf?src-supplier=Element14; ComponentLink2Description: https://datasheet.ciiva.com/7983/1018594-7983509.pdf?src-supplier=Element14; ComponentLink3URL: https://datasheet.ciiva.com/16804/pyu-rc0402-51-rohs-l-6-r-16804406.pdf?src-supplier=Future+Electronics; ComponentLink3Description: https://datasheet.ciiva.com/16804/pyu-rc0402-51-rohs-l-6-r-16804406.pdf?src-supplier=Future+Electronics; ComponentLink4URL: https://datasheet.ciiva.com/15189/getdatasheetpartid-331152-15189383.pdf?src-supplier=Verical; ComponentLink4Description: https://datasheet.ciiva.com/15189/getdatasheetpartid-331152-15189383.pdf?src-supplier=Verical; ComponentLink5URL: https://datasheet.ciiva.com/7849/1018594-7849898.pdf?src-supplier=Element14; ComponentLink5Description: https://datasheet.ciiva.com/7849/1018594-7849898.pdf?src-supplier=Element14; ComponentLink6URL: https://datasheet.ciiva.com/5562/pyu-rc0402-51-rohs-l-6-r-8721-5562539.pdf?src-supplier=Mouser; ComponentLink6Description: https://datasheet.ciiva.com/5562/pyu-rc0402-51-rohs-l-6-r-8721-5562539.pdf?src-supplier=Mouser; ComponentLink7URL: https://datasheet.ciiva.com/7849/1018594-7849899.pdf?src-supplier=Element14; ComponentLink7Description: https://datasheet.ciiva.com/7849/1018594-7849899.pdf?src-supplier=Element14; ComponentLink8URL: https://datasheet.ciiva.com/2553/pyu-r-int-thick-7-2553230.pdf?src-supplier=Digi-Key; ComponentLink8Description: https://datasheet.ciiva.com/2553/pyu-r-int-thick-7-2553230.pdf?src-supplier=Digi-Key; ComponentLink9URL: https://datasheet.ciiva.com/2553/pyu-r-int-thick-7-2553231.pdf?src-supplier=Digi-Key; ComponentLink9Description: https://datasheet.ciiva.com/2553/pyu-r-int-thick-7-2553231.pdf?src-supplier=Digi-Key; Supplier Part Number 1: 311-200LRCT-ND; LCSC Part Number: C114764
TP1-TP4 = TEST POINT: Test Point ON; Item Type: TEST POINT
U4 = SI7145DP-T1-GE3: MOSFET P-CH 30V 60A PPAK SO-8; Manufacturer: Vishay Siliconix; Supplier: Mouser; LCSC Part Number: C144873; Manufacturer Part Number: SI7145DP-T1-GE3; RoHS: Yes; Item Type: MOSFET; Stock: 108048; Pricing: 1=1.84, 10=1.58, 50=1.58, 100=1.32, 1000=1.04, 10000=0.956 (USD); ComponentLink1URL: https://datasheet.ciiva.com/4441/si7145dp-223652-4441979.pdf?src-supplier=Mouser; ComponentLink1Description: https://datasheet.ciiva.com/4441/si7145dp-223652-4441979.pdf?src-supplier=Mouser; ComponentLink2URL: https://datasheet.ciiva.com/6367/si7145dp-6367329.pdf?src-supplier=Digikey; ComponentLink2Description: https://datasheet.ciiva.com/6367/si7145dp-6367329.pdf?src-supplier=Digikey; ComponentLink3URL: https://datasheet.ciiva.com/28599/1913296-28599670.pdf?src-supplier=Element14; ComponentLink3Description: https://datasheet.ciiva.com/28599/1913296-28599670.pdf?src-supplier=Element14; ComponentLink4URL: https://datasheet.ciiva.com/22671/1913296-22671737.pdf?src-supplier=Element14; ComponentLink4Description: https://datasheet.ciiva.com/22671/1913296-22671737.pdf?src-supplier=Element14
U5 = AP63300WU-7: IC REG BUCK ADJ 3A TSOT26; Manufacturer: Diodes; Output Type: Adjustable; Output Configuration: Positive; Number of Outputs: 1; Min Input Voltage: 3.8V; Max Supply Voltage: 32V; Min Output Voltage: 800mV; Max Output Voltage: 31V; Switching Frequency: 500kHz; Synchronous Rectifier: Yes; Supplier: Digikey; Supplier Part Number: 31-AP63300WU-7CT-ND; Manufacturer Part Number: AP63300WU-7; RoHS: No; Category: Voltage Regulators - Switching; Stock: 11398; Pricing: 1=0.92, 10=0.818, 25=0.7764, 100=0.6379, 250=0.59628, 500=0.52696, 1000=0.41602 (USD); Mounting Technology: Surface Mount; Case/Package: SOT-23-6; Min Operating Temperature: -40°C; Max Operating Temperature: 85°C; Series: -; Output Current: 3A; RoHS Compliant: Yes; ComponentLink1URL: https://www.diodes.com/assets/Datasheets/AP63300-AP63301.pdf?src-supplier=Digikey; ComponentLink1Description: https://www.diodes.com/assets/Datasheets/AP63300-AP63301.pdf?src-supplier=Digikey; ComponentLink2URL: https://datasheet.octopart.com/AP63300WU-7-Diodes-Inc.-datasheet-149521342.pdf?src-supplier=Future+Electronics; ComponentLink2Description: https://datasheet.octopart.com/AP63300WU-7-Diodes-Inc.-datasheet-149521342.pdf?src-supplier=Future+Electronics; LCSC Part Number: C2158012; Item Type: IC
U6 = BL8071CLATR33: 70dB@(100Hz) 1.5A Fixed 3.3V~3.3V Positive 6V SOT-223 Linear Voltage Regulators (LDO) ROHS; Manufacturer: BL(Shanghai Belling); Item Type: IC; Manufacturer Part Number: BL8071CLATR33; Package: SOT-223; LCSC Part Number: C401677; ComponentLink1Description: LCSC; ComponentLink1URL: https://www.lcsc.com/product-detail/Linear-Voltage-Regulators-LDO_BL-Shanghai-Belling-BL8071CLATR33_C401677.html

## Sheet Controller_Sheet.SchDoc
size 420 x 297 mm; DocumentNumber: 3; SheetNumber: 3; SheetTotal: 14
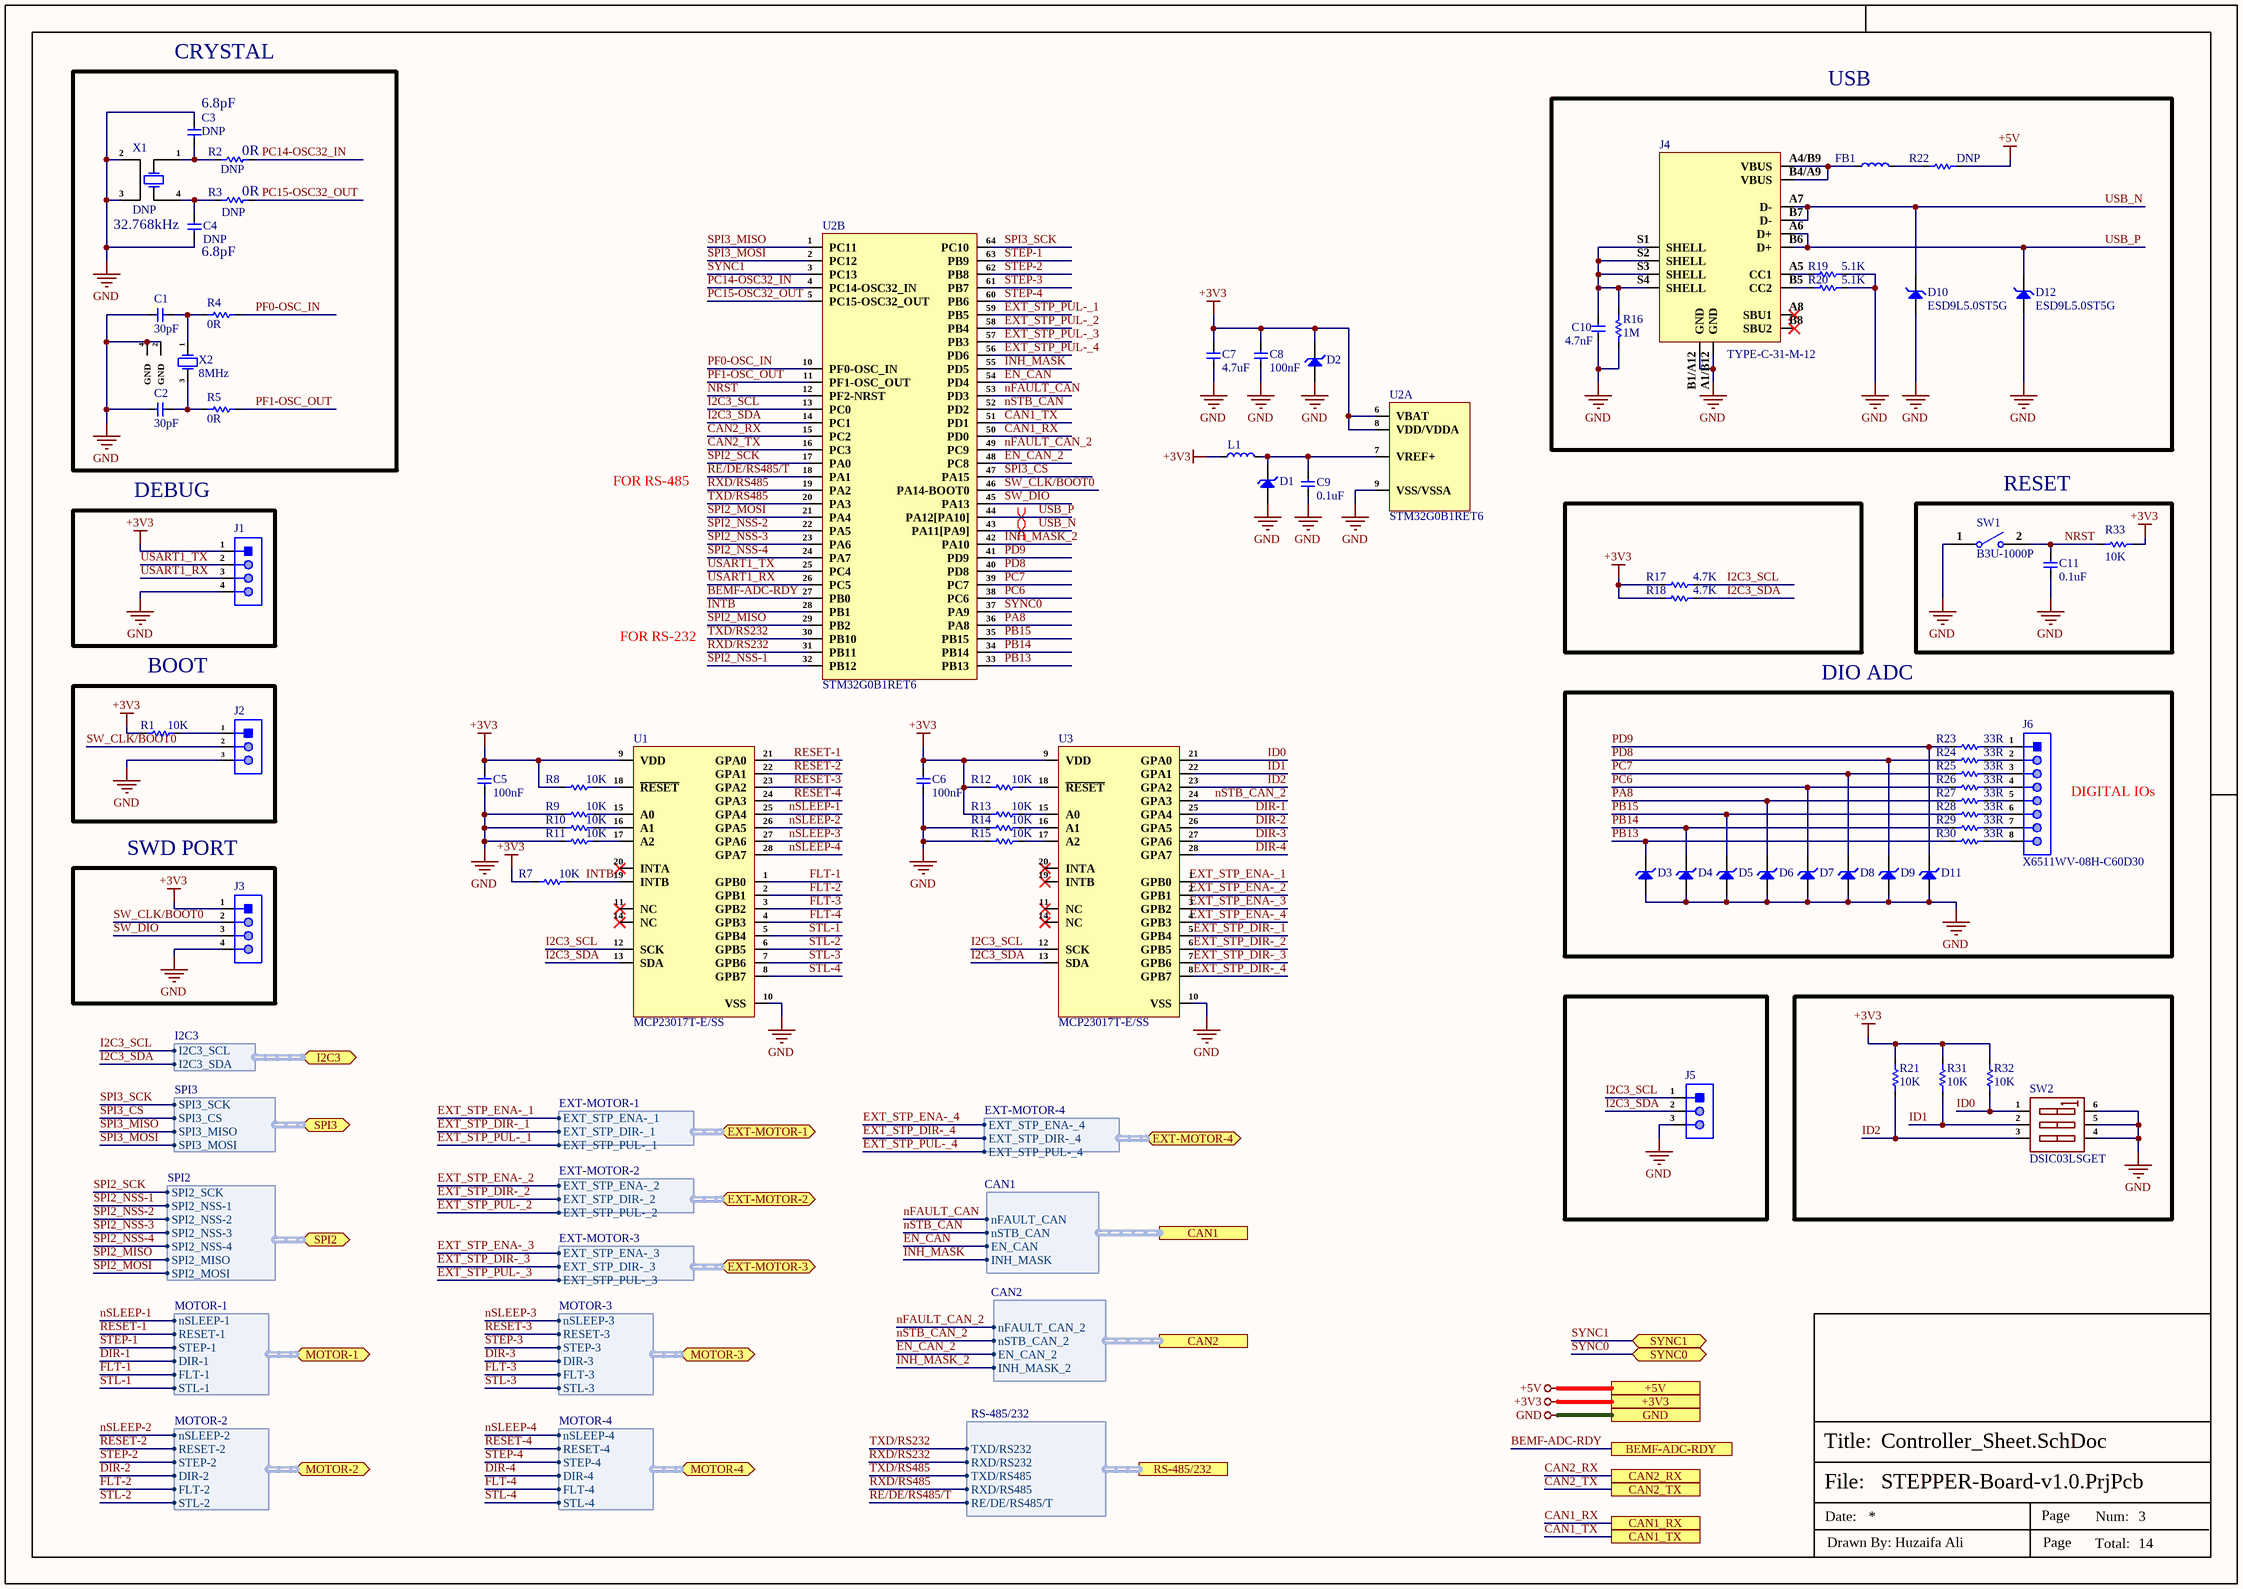
[diagram p2: Controller_Sheet.SchDoc]

### Parts
C1  30pF  [Cap-0402]
C2  30pF  [Cap-0402]
C3  DNP  [Cap-0402]
C4  DNP  [Cap-0402]
C5  100nF  [cap-0402]
C6  100nF  [cap-0402]
C7  4.7uF  [Cap-0402]
C8  100nF  [cap-0402]
C9  0.1uF  [Cap-0402]
C10  4.7nF  [Cap-0603]
C11  0.1uF  [Cap-0402]
D1  SD03  [SOD-323]  (value not drawn)
D2  SD03  [SOD-323]  (value not drawn)
D3  MM3Z3V3  [SOD-323]  (value not drawn)
D4  MM3Z3V3  [SOD-323]  (value not drawn)
D5  MM3Z3V3  [SOD-323]  (value not drawn)
D6  MM3Z3V3  [SOD-323]  (value not drawn)
D7  MM3Z3V3  [SOD-323]  (value not drawn)
D8  MM3Z3V3  [SOD-323]  (value not drawn)
D9  MM3Z3V3  [SOD-323]  (value not drawn)
D10  ESD9L5.0ST5G  [SOD-923.]
D11  MM3Z3V3  [SOD-323]  (value not drawn)
D12  ESD9L5.0ST5G  [SOD-923.]
FB1  BLM18PG221SN1D  [IND-0603 (1608 Metric)]  (value not drawn)
J1  X6511WV-04H-C60D30  [HDR1X4_]  (value not drawn)
J2  68000-103HLF  [HDR1X3_]  (value not drawn)
J3  X6511WV-04H-C60D30  [HDR1X4_]  (value not drawn)
J4  TYPE-C-31-M-12  [TYPE-C-31-M-12_]
J5  B3B-XH-A(LF)(SN)  [B3B-XH-A(LF)(SN)_]  (value not drawn)
J6  X6511WV-08H-C60D30  [HDR 1x8 TH male]
L1  BLM15AG601SN1D  [IND-0402]  (value not drawn)
R1  10K  [Res-0402]
R2  DNP  [Res-0603]
R3  DNP  [Res-0603]
R4  0R  [Res-0603]
R5  0R  [Res-0603]
R7  10K  [Res-0402]
R8  10K  [Res-0402]
R9  10K  [Res-0402]
R10  10K  [Res-0402]
R11  10K  [Res-0402]
R12  10K  [Res-0402]
R13  10K  [Res-0402]
R14  10K  [Res-0402]
R15  10K  [Res-0402]
R16  1M  [Res-0402]
R17  4.7K  [Res-0402]
R18  4.7K  [Res-0402]
R19  5.1K  [Res-0402]
R20  5.1K  [Res-0402]
R21  10K  [Res-0402]
R22  DNP  [Res-0402]
R23  33R  [Res-0402]
R24  33R  [Res-0402]
R25  33R  [Res-0402]
R26  33R  [Res-0402]
R27  33R  [Res-0402]
R28  33R  [Res-0402]
R29  33R  [Res-0402]
R30  33R  [Res-0402]
R31  10K  [Res-0402]
R32  10K  [Res-0402]
R33  10K  [Res-0402]
SW1  B3U-1000P  [B3U-1000P]
SW2  DSIC03LSGET  [DSIC03LSGET]
U1  MCP23017T-E/SS  [SSOP-28-208mil]
U2  STM32G0B1RET6  [LQFP-64(10x10)]  (parts A,B of 2)
U3  MCP23017T-E/SS  [SSOP-28-208mil]
X1  DNP  [MC-306]
X2  8MHz  [5TJ480000XYLBC_]

### Blocks framed on the sheet
CRYSTAL: C1-C4 R2-R5 X1 X2
USB: C10 D10 D12 FB1 J4 R16 R19 R20 R22
DEBUG: J1
RESET: C11 R33 SW1
BOOT: J2 R1
DIO ADC: D3-D9 D11 J6 R23-R30
SWD PORT: J3

### Ports
+3V3 (see Top-Sheet[3A], CAN_Sheet[5D], EtherCAT_Sheet[5D], Power_Sheet[5D], RS485_RS232_Sheet[2D], Stepper_Driver_Sheet[5D]), +5V (see Top-Sheet[3A], CAN_Sheet[5D], Ext_Stepper_Driver_Sheet[5D], Power_Sheet[5D]), BEMF-ADC-RDY (see Top-Sheet[3B], Stepper_Driver_Sheet[3D]), CAN1 (harness CAN1, see Top-Sheet[4A], CAN_Sheet[3D]), CAN1_RX (see Top-Sheet[4A], CAN_Sheet[2D]), CAN1_TX (see Top-Sheet[4A], CAN_Sheet[2D]), CAN2 (harness CAN2, see Top-Sheet[4A], CAN_Sheet[3D]), CAN2_RX (see Top-Sheet[4A], CAN_Sheet[2D]), CAN2_TX (see Top-Sheet[4A], CAN_Sheet[2D]), EXT-MOTOR-1 (bidir, harness EXT-MOTOR-1, see Top-Sheet[4B], Ext_Stepper_Driver_Sheet[2D]), EXT-MOTOR-2 (bidir, harness EXT-MOTOR-2, see Top-Sheet[4B], Ext_Stepper_Driver_Sheet[2D]), EXT-MOTOR-3 (bidir, harness EXT-MOTOR-3, see Top-Sheet[4B], Ext_Stepper_Driver_Sheet[4D]), EXT-MOTOR-4 (bidir, harness EXT-MOTOR-4, see Top-Sheet[4B], Ext_Stepper_Driver_Sheet[4D]), GND (see Top-Sheet[3A], CAN_Sheet[5D], EtherCAT_Sheet[5D], Ext_Stepper_Driver_Sheet[5D], Power_Sheet[5D], RS485_RS232_Sheet[2D], Stepper_Driver_Sheet[5D]), I2C3 (bidir, harness I2C3, see Top-Sheet[3B], Stepper_Driver_Sheet[3D]), MOTOR-1 (bidir, harness MOTOR-1, see Top-Sheet[3B], Stepper_Driver_Sheet[4D]), MOTOR-2 (bidir, harness MOTOR-2, see Top-Sheet[3B], Stepper_Driver_Sheet[4D]), MOTOR-3 (bidir, harness MOTOR-3, see Top-Sheet[3B], Stepper_Driver_Sheet[5D]), MOTOR-4 (bidir, harness MOTOR-4, see Top-Sheet[3B], Stepper_Driver_Sheet[5D]), RS-485/232 (harness RS-485/232, see Top-Sheet[3B], RS485_RS232_Sheet[4D]), SPI2 (bidir, harness SPI2, see Top-Sheet[3B], Stepper_Driver_Sheet[3D]), SPI3 (bidir, harness SPI3, see Top-Sheet[4B], EtherCAT_Sheet[1D]), SYNC0 (bidir, see Top-Sheet[4B], EtherCAT_Sheet[5D]), SYNC1 (bidir, see Top-Sheet[4B], EtherCAT_Sheet[5D])

### Harnesses
RS-485/232: TXD/RS232, RXD/RS232, TXD/RS485, RXD/RS485, RE/DE/RS485/T
CAN1: nFAULT_CAN, nSTB_CAN, EN_CAN, INH_MASK
CAN2: nFAULT_CAN_2, nSTB_CAN_2, EN_CAN_2, INH_MASK_2
SPI3: SPI3_SCK, SPI3_CS, SPI3_MISO, SPI3_MOSI
SPI2: SPI2_NSS-2, SPI2_NSS-3, SPI2_NSS-4, SPI2_SCK, SPI2_MOSI, SPI2_MISO, SPI2_NSS-1
I2C3: I2C3_SCL, I2C3_SDA
MOTOR-1: nSLEEP-1, RESET-1, STEP-1, DIR-1, FLT-1, STL-1
MOTOR-2: nSLEEP-2, RESET-2, STEP-2, DIR-2, FLT-2, STL-2
MOTOR-3: nSLEEP-3, RESET-3, STEP-3, DIR-3, FLT-3, STL-3
MOTOR-4: nSLEEP-4, RESET-4, STEP-4, DIR-4, FLT-4, STL-4
EXT-MOTOR-1: EXT_STP_ENA-_1, EXT_STP_DIR-_1, EXT_STP_PUL-_1
EXT-MOTOR-2: EXT_STP_ENA-_2, EXT_STP_DIR-_2, EXT_STP_PUL-_2
EXT-MOTOR-3: EXT_STP_ENA-_3, EXT_STP_DIR-_3, EXT_STP_PUL-_3
EXT-MOTOR-4: EXT_STP_ENA-_4, EXT_STP_DIR-_4, EXT_STP_PUL-_4

### Nets
+3V3: C5.2 C6.2 C7.2 C8.2 D2.1(K) J1.1 J3.1 L1.1 R1.2 R7.2 R8.2 R12.2 R13.2 R17.2 R18.2 R21.2 R31.2 R32.2 R33.2 U1.9(VDD) U2.6(VBAT) U2.8(VDD/VDDA) U3.9(VDD) ; port +3V3
+5V: R22.2 ; port +5V
GND: C1.1 C2.1 C3.1 C4.2 C5.1 C6.1 C7.1 C8.1 C9.1 C10.1 C11.1 D1.2(A) D2.2(A) D3.2(A) D4.2(A) D5.2(A) D6.2(A) D7.2(A) D8.2(A) D9.2(A) D10.2(A) D11.2(A) D12.2(A) J1.4 J2.3 J3.4 J4.A1/B12(GND) J4.B1/A12(GND) J5.3 R9.2 R10.2 R11.2 R14.2 R15.2 R16.2 R19.2 R20.2 SW1.1 SW2.4(B3) SW2.5(B2) SW2.6(B1) U1.10(VSS) U2.9(VSS/VSSA) U3.10(VSS) X1.2 X1.3 X2.2(GND) X2.4(GND) ; port GND
BEMF-ADC-RDY: U2.27(PB0) ; port BEMF-ADC-RDY
CAN1_RX: U2.50(PD0) ; port CAN1_RX
CAN1_TX: U2.51(PD1) ; port CAN1_TX
CAN2_RX: U2.15(PC2) ; port CAN2_RX
CAN2_TX: U2.16(PC3) ; port CAN2_TX
DIR-1: U3.25(GPA4) ; port MOTOR-1.DIR-1
DIR-2: U3.26(GPA5) ; port MOTOR-2.DIR-2
DIR-3: U3.27(GPA6) ; port MOTOR-3.DIR-3
DIR-4: U3.28(GPA7) ; port MOTOR-4.DIR-4
EN_CAN: U2.54(PD4) ; port CAN1.EN_CAN
EN_CAN_2: U2.48(PC8) ; port CAN2.EN_CAN_2
EXT_STP_DIR-_1: U3.5(GPB4) ; port EXT-MOTOR-1.EXT_STP_DIR-_1
EXT_STP_DIR-_2: U3.6(GPB5) ; port EXT-MOTOR-2.EXT_STP_DIR-_2
EXT_STP_DIR-_3: U3.7(GPB6) ; port EXT-MOTOR-3.EXT_STP_DIR-_3
EXT_STP_DIR-_4: U3.8(GPB7) ; port EXT-MOTOR-4.EXT_STP_DIR-_4
EXT_STP_ENA-_1: U3.1(GPB0) ; port EXT-MOTOR-1.EXT_STP_ENA-_1
EXT_STP_ENA-_2: U3.2(GPB1) ; port EXT-MOTOR-2.EXT_STP_ENA-_2
EXT_STP_ENA-_3: U3.3(GPB2) ; port EXT-MOTOR-3.EXT_STP_ENA-_3
EXT_STP_ENA-_4: U3.4(GPB3) ; port EXT-MOTOR-4.EXT_STP_ENA-_4
EXT_STP_PUL-_1: U2.59(PB5) ; port EXT-MOTOR-1.EXT_STP_PUL-_1
EXT_STP_PUL-_2: U2.58(PB4) ; port EXT-MOTOR-2.EXT_STP_PUL-_2
EXT_STP_PUL-_3: U2.57(PB3) ; port EXT-MOTOR-3.EXT_STP_PUL-_3
EXT_STP_PUL-_4: U2.56(PD6) ; port EXT-MOTOR-4.EXT_STP_PUL-_4
FLT-1: U1.1(GPB0) ; port MOTOR-1.FLT-1
FLT-2: U1.2(GPB1) ; port MOTOR-2.FLT-2
FLT-3: U1.3(GPB2) ; port MOTOR-3.FLT-3
FLT-4: U1.4(GPB3) ; port MOTOR-4.FLT-4
I2C3_SCL: J5.1 R17.1 U1.12(SCK) U2.13(PC0) U3.12(SCK) ; port I2C3.I2C3_SCL
I2C3_SDA: J5.2 R18.1 U1.13(SDA) U2.14(PC1) U3.13(SDA) ; port I2C3.I2C3_SDA
ID0: R32.1 SW2.1(A1) U3.21(GPA0)
ID1: R31.1 SW2.2(A2) U3.22(GPA1)
ID2: R21.1 SW2.3(A3) U3.23(GPA2)
INH_MASK: U2.55(PD5) ; port CAN1.INH_MASK
INH_MASK_2: U2.42(PA10) ; port CAN2.INH_MASK_2
INTB: R7.1 U1.19(INTB) U2.28(PB1)
nFAULT_CAN: U2.53(PD3) ; port CAN1.nFAULT_CAN
nFAULT_CAN_2: U2.49(PC9) ; port CAN2.nFAULT_CAN_2
NRST: C11.2 R33.1 SW1.2 U2.12(PF2-NRST)
nSLEEP-1: U1.25(GPA4) ; port MOTOR-1.nSLEEP-1
nSLEEP-2: U1.26(GPA5) ; port MOTOR-2.nSLEEP-2
nSLEEP-3: U1.27(GPA6) ; port MOTOR-3.nSLEEP-3
nSLEEP-4: U1.28(GPA7) ; port MOTOR-4.nSLEEP-4
nSTB_CAN: U2.52(PD2) ; port CAN1.nSTB_CAN
nSTB_CAN_2: U3.24(GPA3) ; port CAN2.nSTB_CAN_2
PA8: D6.1(K) R27.1 U2.36(PA8)
PB13: D3.1(K) R30.1 U2.33(PB13)
PB14: D4.1(K) R29.1 U2.34(PB14)
PB15: D5.1(K) R28.1 U2.35(PB15)
PC6: D7.1(K) R26.1 U2.38(PC6)
PC7: D8.1(K) R25.1 U2.39(PC7)
PC14-OSC32_IN: R2.2 U2.4(PC14-OSC32_IN)
PC15-OSC32_OUT: R3.2 U2.5(PC15-OSC32_OUT)
PD8: D9.1(K) R24.1 U2.40(PD8)
PD9: D11.1(K) R23.1 U2.41(PD9)
PF0-OSC_IN: R4.2 U2.10(PF0-OSC_IN)
PF1-OSC_OUT: R5.2 U2.11(PF1-OSC_OUT)
RE/DE/RS485/T: U2.18(PA1) ; port RS-485/232.RE/DE/RS485/T
RESET-1: U1.21(GPA0) ; port MOTOR-1.RESET-1
RESET-2: U1.22(GPA1) ; port MOTOR-2.RESET-2
RESET-3: U1.23(GPA2) ; port MOTOR-3.RESET-3
RESET-4: U1.24(GPA3) ; port MOTOR-4.RESET-4
RXD/RS232: U2.31(PB11) ; port RS-485/232.RXD/RS232
RXD/RS485: U2.19(PA2) ; port RS-485/232.RXD/RS485
SPI2_MISO: U2.29(PB2) ; port SPI2.SPI2_MISO
SPI2_MOSI: U2.21(PA4) ; port SPI2.SPI2_MOSI
SPI2_NSS-1: U2.32(PB12) ; port SPI2.SPI2_NSS-1
SPI2_NSS-2: U2.22(PA5) ; port SPI2.SPI2_NSS-2
SPI2_NSS-3: U2.23(PA6) ; port SPI2.SPI2_NSS-3
SPI2_NSS-4: U2.24(PA7) ; port SPI2.SPI2_NSS-4
SPI2_SCK: U2.17(PA0) ; port SPI2.SPI2_SCK
SPI3_CS: U2.47(PA15) ; port SPI3.SPI3_CS
SPI3_MISO: U2.1(PC11) ; port SPI3.SPI3_MISO
SPI3_MOSI: U2.2(PC12) ; port SPI3.SPI3_MOSI
SPI3_SCK: U2.64(PC10) ; port SPI3.SPI3_SCK
STEP-1: U2.63(PB9) ; port MOTOR-1.STEP-1
STEP-2: U2.62(PB8) ; port MOTOR-2.STEP-2
STEP-3: U2.61(PB7) ; port MOTOR-3.STEP-3
STEP-4: U2.60(PB6) ; port MOTOR-4.STEP-4
STL-1: U1.5(GPB4) ; port MOTOR-1.STL-1
STL-2: U1.6(GPB5) ; port MOTOR-2.STL-2
STL-3: U1.7(GPB6) ; port MOTOR-3.STL-3
STL-4: U1.8(GPB7) ; port MOTOR-4.STL-4
SW_CLK/BOOT0: J2.2 J3.2 U2.46(PA14-BOOT0)
SW_DIO: J3.3 U2.45(PA13)
SYNC0: U2.37(PA9) ; port SYNC0
SYNC1: U2.3(PC13) ; port SYNC1
TXD/RS232: U2.30(PB10) ; port RS-485/232.TXD/RS232
TXD/RS485: U2.20(PA3) ; port RS-485/232.TXD/RS485
USART1_RX: J1.3 U2.26(PC5)
USART1_TX: J1.2 U2.25(PC4)
USB_N: D10.1(K) J4.A7(D-) J4.B7(D-) U2.43(PA11[PA9])
USB_P: D12.1(K) J4.A6(D+) J4.B6(D+) U2.44(PA12[PA10])
NetC1_2: C1.2 R4.1 X2.1(OSC1)
NetC2_2: C2.2 R5.1 X2.3(OSC2)
NetC3_2: C3.2 R2.1 X1.1(OSC1)
NetC4_1: C4.1 R3.1 X1.4(OSC2)
NetC9_2: C9.2 D1.1(K) L1.2 U2.7(VREF+)
NetC10_2: C10.2 J4.S1(SHELL) J4.S2(SHELL) J4.S3(SHELL) J4.S4(SHELL) R16.1
NetFB1_1: FB1.1 J4.A4/B9(VBUS) J4.B4/A9(VBUS)
NetFB1_2: FB1.2 R22.1
NetJ2_1: J2.1 R1.1
NetJ4_A5: J4.A5(CC1) R19.1
NetJ4_B5: J4.B5(CC2) R20.1
NetJ6_1: J6.1 R23.2
NetJ6_2: J6.2 R24.2
NetJ6_3: J6.3 R25.2
NetJ6_4: J6.4 R26.2
NetJ6_5: J6.5 R27.2
NetJ6_6: J6.6 R28.2
NetJ6_7: J6.7 R29.2
NetJ6_8: J6.8 R30.2
NetR8_1: R8.1 U1.18(~{RESET})
NetR9_1: R9.1 U1.15(A0)
NetR10_1: R10.1 U1.16(A1)
NetR11_1: R11.1 U1.17(A2)
NetR12_1: R12.1 U3.18(~{RESET})
NetR13_1: R13.1 U3.15(A0)
NetR14_1: R14.1 U3.16(A1)
NetR15_1: R15.1 U3.17(A2)

Not connected (* = marked no-connect by the designer): J4 A8(SBU1)* B8(SBU2)*; U1 11(NC)* 14(NC)* 20(INTA)*; U3 11(NC)* 14(NC)* 19(INTB)* 20(INTA)*

### Layout directives
differential pair; net class USB_PROGRAM; differential pair class USB_PROGRAM_LINES; rule Impedance Constraint [Min = 85.00    Max = 90.00    ]; rule Matched Net Lengths [Tolerance = 50mil]: USB_N, USB_P

### Notes on the sheet
- (near C3) 6.8pF
- (near R2) 0R
- 32.768kHz
- (near C4) 6.8pF
- (near R3) 0R
- FOR RS-485
- FOR RS-232
- (near J6) DIGITAL IOs
- DIGITAL IOs REQUESTED BY CLIENT
- File:
- Title:
- Date:
- Page
- Num:
- Total:
- Drawn By: Huzaifa Ali